# Altium project KJ_Turret_Command.PrjPcb
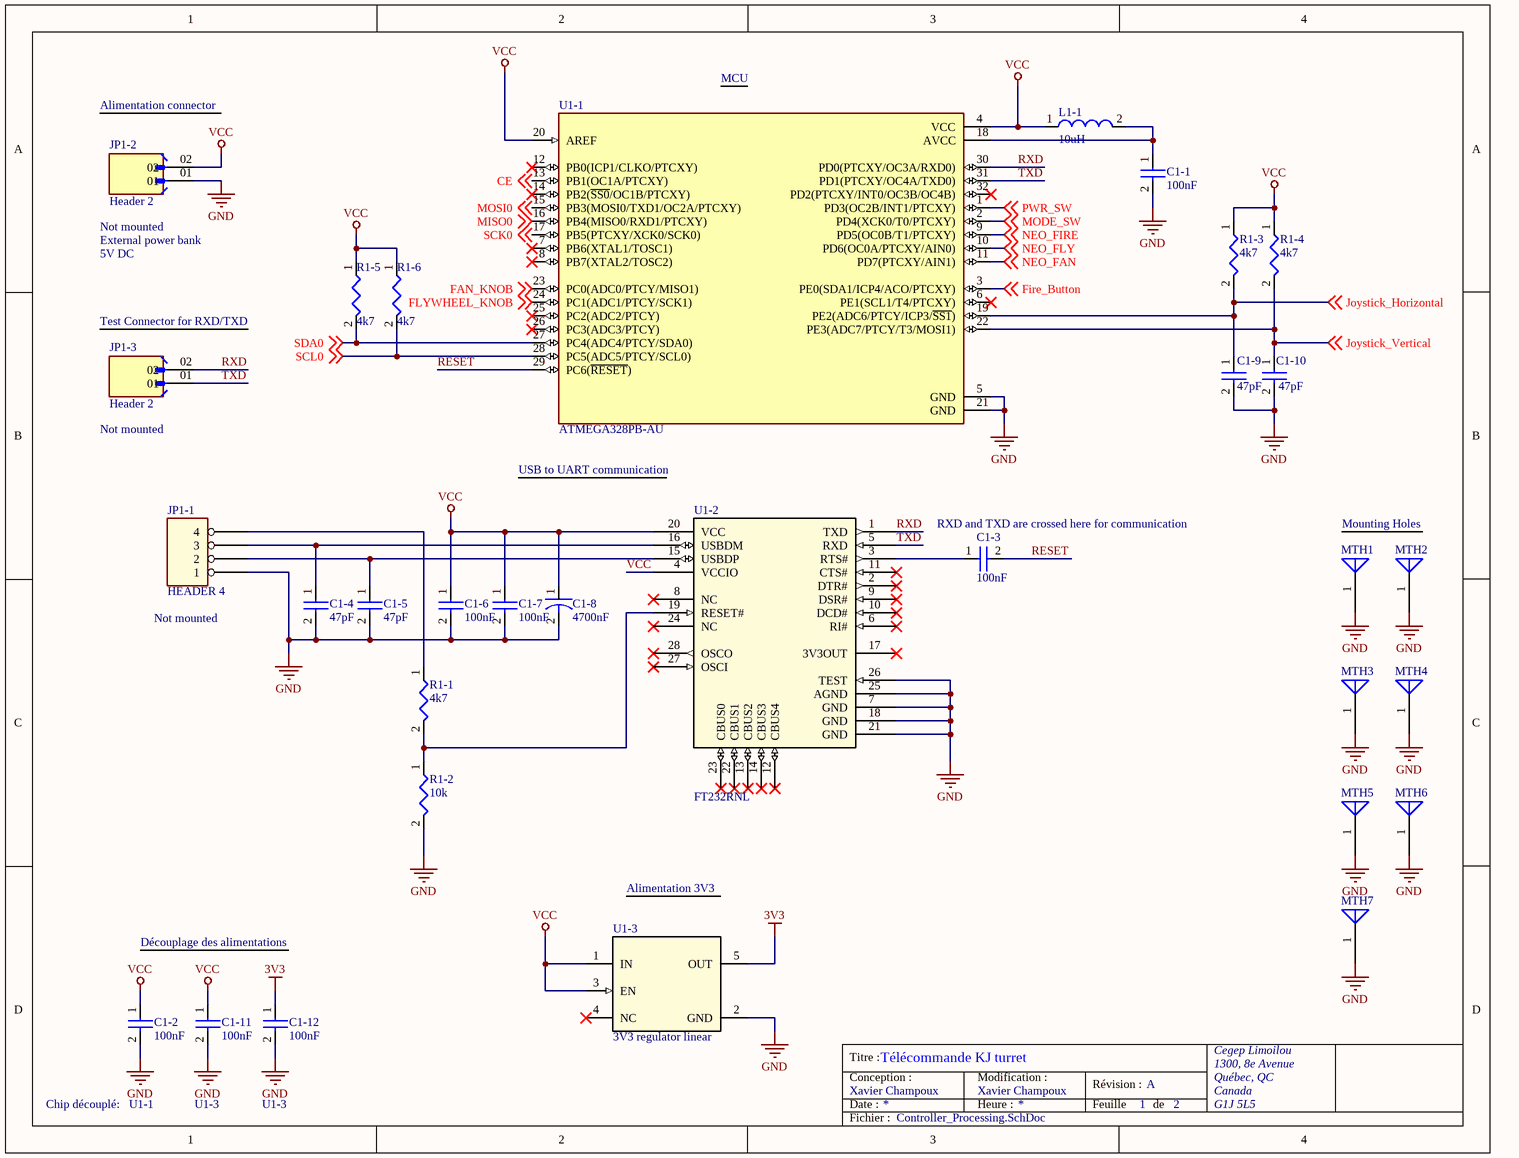
[diagram p0: Controller_Processing.SchDoc]
2 sheets, 66 parts. Net scope: global (net labels, ports and power ports of the same name join across sheets).
Board file: Controller.PcbDoc
Sheets:
  Controller_Processing.SchDoc
  Controller_Accessories.SchDoc

## Sheet Controller_Processing.SchDoc
size Letter; Organization: Cegep Limoilou; Address1: 1300, 8e Avenue; Address2: Québec, QC; Address3: Canada; Address4: G1J 5L5; Revision: A; SheetNumber: 1; SheetTotal: 2; Conception: Xavier Champoux; Titre: Télécommande KJ turret; Modification: Xavier Champoux

### Parts
C1-1  100nF  [0805_SMD]
C1-2  100nF  [0805_SMD]
C1-3  100nF  [0805_SMD]
C1-4  47pF  [0805_SMD]
C1-5  47pF  [0805_SMD]
C1-6  100nF  [0805_SMD]
C1-7  100nF  [0805_SMD]
C1-8  4700nF  [0805_SMD]
C1-9  47pF  [0805_SMD]
C1-10  47pF  [0805_SMD]
C1-11  100nF  [0805_SMD]
C1-12  100nF  [0805_SMD]
JP1-1  HEADER 4  [Header 4]
JP1-2  Header 2  [Header 2]
JP1-3  Header 2  [Header 2]
L1-1  10uH  [0805_SMD]
MTH1  ANTENNA  [MountingHole]  (value not drawn)
MTH2  ANTENNA  [MountingHole]  (value not drawn)
MTH3  ANTENNA  [MountingHole]  (value not drawn)
MTH4  ANTENNA  [MountingHole]  (value not drawn)
MTH5  ANTENNA  [MountingHole]  (value not drawn)
MTH6  ANTENNA  [MountingHole]  (value not drawn)
MTH7  ANTENNA  [MountingHole]  (value not drawn)
R1-1  4k7  [0805_SMD]
R1-2  10k  [0805_SMD]
R1-3  4k7  [0805_SMD]
R1-4  4k7  [0805_SMD]
R1-5  4k7  [0805_SMD]
R1-6  4k7  [0805_SMD]
U1-1  ATMEGA328PB-AU  [QFP80P900X900X120-32N]
U1-2  FT232RNL  [SSOP-28_FTD]
U1-3  3V3 regulator linear  [DBV0005A-IPC_A]

### Nets
3V3: C1-12.1 U1-3.5(OUT)
GND: C1-1.2 C1-2.2 C1-4.2 C1-5.2 C1-6.2 C1-7.2 C1-8.2 C1-9.2 C1-10.2 C1-11.2 C1-12.2 JP1-1.1 JP1-2.01 MTH1.1 MTH2.1 MTH3.1 MTH4.1 MTH5.1 MTH6.1 MTH7.1 R1-2.2 U1-1.5(GND) U1-1.21(GND) U1-2.7(GND) U1-2.18(GND) U1-2.21(GND) U1-2.25(AGND) U1-2.26(TEST) U1-3.2(GND)
VCC: C1-2.1 C1-6.1 C1-7.1 C1-8.1 C1-11.1 JP1-2.02 L1-1.1 R1-3.1 R1-4.1 R1-5.1 R1-6.1 U1-1.4(VCC) U1-1.20(AREF) U1-2.4(VCCIO) U1-2.20(VCC) U1-3.1(IN) U1-3.3(EN)
CE: U1-1.13(PB1(OC1A/PTCXY)) ; off-sheet CE
FAN_KNOB: U1-1.23(PC0(ADC0/PTCY/MISO1)) ; off-sheet FAN_KNOB
Fire_Button: U1-1.3(PE0(SDA1/ICP4/ACO/PTCXY)) ; off-sheet Fire_Button
FLYWHEEL_KNOB: U1-1.24(PC1(ADC1/PTCY/SCK1)) ; off-sheet FLYWHEEL_KNOB
Joystick_Horizontal: C1-9.1 R1-3.2 U1-1.19(PE2(ADC6/PTCY/ICP3/~{SS1})) ; off-sheet Joystick_Horizontal
Joystick_Vertical: C1-10.1 R1-4.2 U1-1.22(PE3(ADC7/PTCY/T3/MOSI1)) ; off-sheet Joystick_Vertical
MISO0: U1-1.16(PB4(MISO0/RXD1/PTCXY)) ; off-sheet MISO0
MODE_SW: U1-1.2(PD4(XCK0/T0/PTCXY)) ; off-sheet MODE_SW
MOSI0: U1-1.15(PB3(MOSI0/TXD1/OC2A/PTCXY)) ; off-sheet MOSI0
NEO_FAN: U1-1.11(PD7(PTCXY/AIN1)) ; off-sheet NEO_FAN
NEO_FIRE: U1-1.9(PD5(OC0B/T1/PTCXY)) ; off-sheet NEO_FIRE
NEO_FLY: U1-1.10(PD6(OC0A/PTCXY/AIN0)) ; off-sheet NEO_FLY
PWR_SW: U1-1.1(PD3(OC2B/INT1/PTCXY)) ; off-sheet PWR_SW
RESET: C1-3.2 U1-1.29(PC6(~{RESET}))
RXD: JP1-3.02 U1-1.30(PD0(PTCXY/OC3A/RXD0)) U1-2.1(TXD)
SCK0: U1-1.17(PB5(PTCXY/XCK0/SCK0)) ; off-sheet SCK0
SCL0: R1-6.2 U1-1.28(PC5(ADC5/PTCY/SCL0)) ; off-sheet SCL0
SDA0: R1-5.2 U1-1.27(PC4(ADC4/PTCY/SDA0)) ; off-sheet SDA0
TXD: JP1-3.01 U1-1.31(PD1(PTCXY/OC4A/TXD0)) U1-2.5(RXD)
NetC1-1_1: C1-1.1 L1-1.2 U1-1.18(AVCC)
NetC1-3_1: C1-3.1 U1-2.3(RTS#)
NetC1-4_1: C1-4.1 JP1-1.3 U1-2.16(USBDM)
NetC1-5_1: C1-5.1 JP1-1.2 U1-2.15(USBDP)
NetJP1-1_4: JP1-1.4 R1-1.1
NetR1-1_2: R1-1.2 R1-2.1 U1-2.19(RESET#)

Not connected (* = marked no-connect by the designer): U1-1 6(PE1(SCL1/T4/PTCXY))* 7(PB6(XTAL1/TOSC1))* 8(PB7(XTAL2/TOSC2))* 12(PB0(ICP1/CLKO/PTCXY))* 14(PB2(~{SS0}/OC1B/PTCXY))* 25(PC2(ADC2/PTCY))* 26(PC3(ADC3/PTCY))* 32(PD2(PTCXY/INT0/OC3B/OC4B))*; U1-2 2(DTR#)* 6(RI#)* 8(NC)* 9(DSR#)* 10(DCD#)* 11(CTS#)* 12(CBUS4)* 13(CBUS2)* 14(CBUS3)* 17(3V3OUT)* 22(CBUS1)* 23(CBUS0)* 24(NC)* 27(OSCI)* 28(OSCO)*; U1-3 4(NC)*

### Notes on the sheet
- (near U1-1) MCU
- Alimentation connector
- (near JP1-2) Not mounted
- External power bank
- 5V DC
- (near JP1-3) Test Connector for RXD/TXD
- (near JP1-3) Not mounted
- USB to UART communication
- (near C1-3) RXD and TXD are crossed here for communication
- Mounting Holes
- (near JP1-1) Not mounted
- Alimentation 3V3
- Découplage des alimentations
- Chip découplé:   U1-1
- U1-3
- Titre :
- Conception :
- Date :
- Modification :
- Heure :
- Révision :
- Feuille
- de
- Fichier :

### Library data of the parts
C1-1-C1-7 C1-9-C1-12 = CAP NP
C1-8 = CAP
JP1-2 JP1-3 = Header 2: MP: GRPB021VWVN-RC; Package: None; Availability: Unavailable; Price: None; Value: *
L1-1 = INDUCTOR
R1-1-R1-6 = R
U1-1 = ATMEGA328PB-AU: MF: Microchip; SnapEDA_Link: https://www.snapeda.com/parts/ATMEGA328PB-AU/Microchip/view-part/?ref=snap; Package: TQFP-32 Microchip; Value: *; MP: ATMEGA328PB-AU; Check_prices: https://www.snapeda.com/parts/ATMEGA328PB-AU/Microchip/view-part/?ref=eda
U1-2 = FT232RNL: Mfr_Name: FTDI, Future Technology Devices International Ltd; RefDes: RefDes; Type: Type
U1-3 = 3V3 regulator linear: No Description Available; Mfr_Name: Texas Instruments; TYPE: TYPE; RefDes: RefDes

## Sheet Controller_Accessories.SchDoc
size Letter; Organization: Cegep Limoilou; Address1: 1300, 8e Avenue; Address2: Québec, QC; Address3: Canada; Address4: G1J 5L5; Revision: A; SheetNumber: 2; SheetTotal: 2; Conception: Xavier Champoux; Titre: Télécommande KJ Turret; Modification: Xavier Champoux
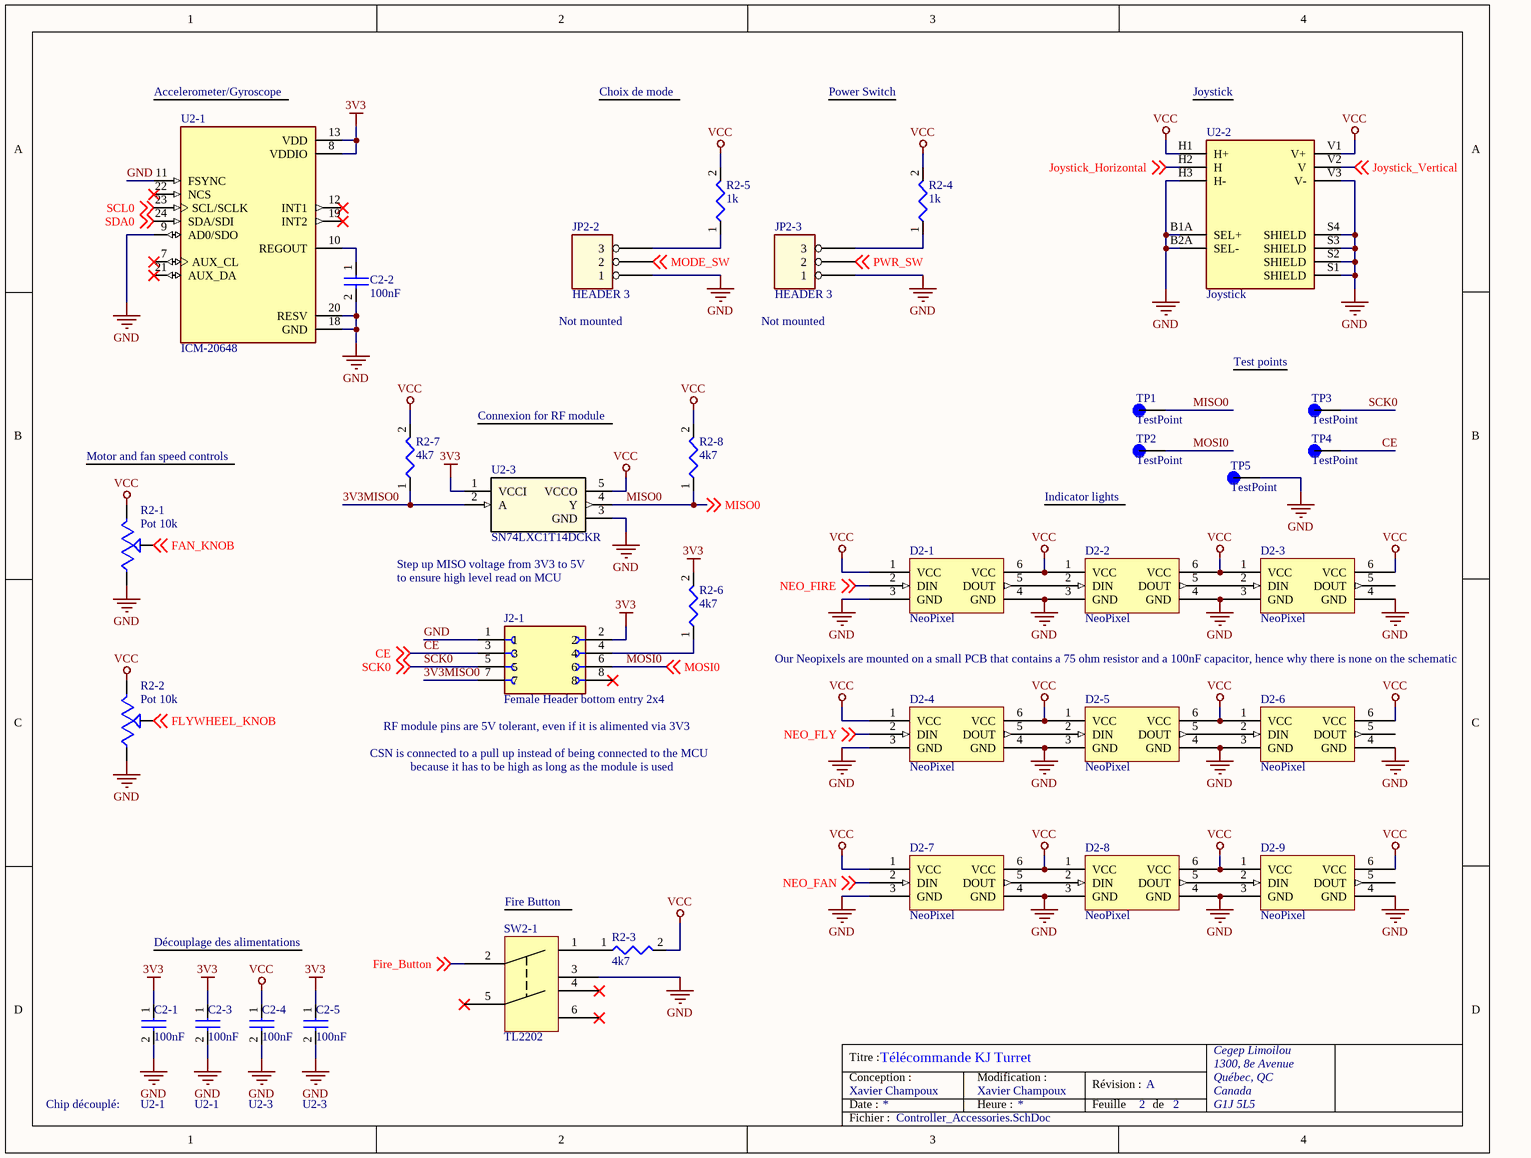
[diagram p1: Controller_Accessories.SchDoc]

### Parts
C2-1  100nF  [0805_SMD]
C2-2  100nF  [0805_SMD]
C2-3  100nF  [0805_SMD]
C2-4  100nF  [0805_SMD]
C2-5  100nF  [0805_SMD]
D2-1  NeoPixel  [NeoPixel]
D2-2  NeoPixel  [NeoPixel]
D2-3  NeoPixel  [NeoPixel]
D2-4  NeoPixel  [NeoPixel]
D2-5  NeoPixel  [NeoPixel]
D2-6  NeoPixel  [NeoPixel]
D2-7  NeoPixel  [NeoPixel]
D2-8  NeoPixel  [NeoPixel]
D2-9  NeoPixel  [NeoPixel]
J2-1  Female Header bottom entry 2x4  [AMPHENOL_71991-306LF]
JP2-2  HEADER 3  [Header 3]
JP2-3  HEADER 3  [Header 3]
R2-1  Pot 10k  [TRIM_PT01-D120K2-B103]
R2-2  Pot 10k  [TRIM_PT01-D120K2-B103]
R2-3  4k7  [0805_SMD]
R2-4  1k  [0805_SMD]
R2-5  1k  [0805_SMD]
R2-6  4k7  [0805_SMD]
R2-7  4k7  [0805_SMD]
R2-8  4k7  [0805_SMD]
SW2-1  TL2202  [TL2202]
TP1  TestPoint  [KEYSTONE_5006]
TP2  TestPoint  [KEYSTONE_5006]
TP3  TestPoint  [KEYSTONE_5006]
TP4  TestPoint  [KEYSTONE_5006]
TP5  TestPoint  [KEYSTONE_5006]
U2-1  ICM-20648  [QFN40P300X300X95-24N]
U2-2  Joystick  [XDCR_COM-09032]
U2-3  SN74LXC1T14DCKR  [DCK0005A-IPC_A]

### Nets
3V3: C2-1.1 C2-3.1 C2-5.1 J2-1.2 R2-6.2 U2-1.8(VDDIO) U2-1.13(VDD) U2-3.1(VCCI)
GND: C2-1.2 C2-2.2 C2-3.2 C2-4.2 C2-5.2 D2-1.3(GND) D2-1.4(GND) D2-2.3(GND) D2-2.4(GND) D2-3.3(GND) D2-3.4(GND) D2-4.3(GND) D2-4.4(GND) D2-5.3(GND) D2-5.4(GND) D2-6.3(GND) D2-6.4(GND) D2-7.3(GND) D2-7.4(GND) D2-8.3(GND) D2-8.4(GND) D2-9.3(GND) D2-9.4(GND) J2-1.1 JP2-2.1 JP2-3.1 R2-1.3 R2-2.3 SW2-1.3 TP5.TP U2-1.9(AD0/SDO) U2-1.11(FSYNC) U2-1.18(GND) U2-1.20(RESV) U2-2.B1A(SEL+) U2-2.B2A(SEL-) U2-2.H3(H-) U2-2.S1(SHIELD) U2-2.S2(SHIELD) U2-2.S3(SHIELD) U2-2.S4(SHIELD) U2-2.V3(V-) U2-3.3(GND)
VCC: C2-4.1 D2-1.1(VCC) D2-1.6(VCC) D2-2.1(VCC) D2-2.6(VCC) D2-3.1(VCC) D2-3.6(VCC) D2-4.1(VCC) D2-4.6(VCC) D2-5.1(VCC) D2-5.6(VCC) D2-6.1(VCC) D2-6.6(VCC) D2-7.1(VCC) D2-7.6(VCC) D2-8.1(VCC) D2-8.6(VCC) D2-9.1(VCC) D2-9.6(VCC) R2-1.1 R2-2.1 R2-3.2 R2-4.2 R2-5.2 R2-7.2 R2-8.2 U2-2.H1(H+) U2-2.V1(V+) U2-3.5(VCCO)
3V3MISO0: J2-1.7 R2-7.1 U2-3.2(A)
CE: J2-1.3 TP4.TP ; off-sheet CE
FAN_KNOB: R2-1.2 ; off-sheet FAN_KNOB
Fire_Button: SW2-1.2 ; off-sheet Fire_Button
FLYWHEEL_KNOB: R2-2.2 ; off-sheet FLYWHEEL_KNOB
Joystick_Horizontal: U2-2.H2(H) ; off-sheet Joystick_Horizontal
Joystick_Vertical: U2-2.V2(V) ; off-sheet Joystick_Vertical
MISO0: R2-8.1 TP1.TP U2-3.4(Y) ; off-sheet MISO0
MODE_SW: JP2-2.2 ; off-sheet MODE_SW
MOSI0: J2-1.6 TP2.TP ; off-sheet MOSI0
NEO_FAN: D2-7.2(DIN) ; off-sheet NEO_FAN
NEO_FIRE: D2-1.2(DIN) ; off-sheet NEO_FIRE
NEO_FLY: D2-4.2(DIN) ; off-sheet NEO_FLY
PWR_SW: JP2-3.2 ; off-sheet PWR_SW
SCK0: J2-1.5 TP3.TP ; off-sheet SCK0
SCL0: U2-1.23(SCL/SCLK) ; off-sheet SCL0
SDA0: U2-1.24(SDA/SDI) ; off-sheet SDA0
NetC2-2_1: C2-2.1 U2-1.10(REGOUT)
NetD2-1_5: D2-1.5(DOUT) D2-2.2(DIN)
NetD2-2_5: D2-2.5(DOUT) D2-3.2(DIN)
NetD2-4_5: D2-4.5(DOUT) D2-5.2(DIN)
NetD2-5_5: D2-5.5(DOUT) D2-6.2(DIN)
NetD2-7_5: D2-7.5(DOUT) D2-8.2(DIN)
NetD2-8_5: D2-8.5(DOUT) D2-9.2(DIN)
NetJ2-1_4: J2-1.4 R2-6.1
NetJP2-2_3: JP2-2.3 R2-5.1
NetJP2-3_3: JP2-3.3 R2-4.1
NetR2-3_1: R2-3.1 SW2-1.1

Not connected (* = marked no-connect by the designer): D2-3 5(DOUT); D2-6 5(DOUT); D2-9 5(DOUT); J2-1 8*; SW2-1 4* 5* 6*; U2-1 7(AUX_CL)* 12(INT1)* 19(INT2)* 21(AUX_DA)* 22(NCS)*

### Notes on the sheet
- (near U2-1) Accelerometer/Gyroscope
- Choix de mode
- Power Switch
- Joystick
- (near JP2-2) Not mounted
- (near JP2-3) Not mounted
- (near TP3) Test points
- Connexion for RF module
- Motor and fan speed controls
- (near TP2) Indicator lights
- (near U2-3) Step up MISO voltage from 3V3 to 5V
- to ensure high level read on MCU
- Our Neopixels are mounted on a small PCB that contains a 75 ohm resistor and a 100nF capacitor, hence why there is none on the schematic
- CSN is connected to a pull up instead of being connected to the MCU
- (near J2-1) RF module pins are 5V tolerant, even if it is alimented via 3V3
- because it has to be high as long as the module is used
- Fire Button
- Découplage des alimentations
- Chip découplé:
- U2-1
- U2-3
- Titre :
- Conception :
- Date :
- Modification :
- Heure :
- Révision :
- Feuille
- de
- Fichier :

### Library data of the parts
C2-1-C2-5 = CAP NP
J2-1 = Female Header bottom entry 2x4: MF: Amphenol; MP: 71991-306LF; Package: None; Price: None; Check_prices: https://www.snapeda.com/parts/71991-306LF/Amphenol/view-part/?ref=eda; Value: *; SnapEDA_Link: https://www.snapeda.com/parts/71991-306LF/Amphenol/view-part/?ref=snap; Availability: In Stock; Purchase-URL: https://pricing.snapeda.com/search?q=71991-306LF&ref=eda
R2-1 R2-2 = Potentiometer knob: MP: PT01-D120K2-B103; Value: *; Availability: Unavailable; Package: None; Price: None
R2-3-R2-8 = R
TP1-TP5 = TestPoint: MF: Keystone Electronics Corp.; MP: 5006; SnapEDA_Link: https://www.snapeda.com/parts/5006/Keystone/view-part/?ref=snap; Package: NON STANDARD-1 Keystone; Value: *; Check_prices: https://www.snapeda.com/parts/5006/Keystone/view-part/?ref=eda
U2-1 = ICM-20648: MF: TDK InvenSense; MP: ICM-20648; Package: QFN-24 InvenSense; Price: None; Value: *; SnapEDA_Link: https://www.snapeda.com/parts/ICM-20648/TDK%20InvenSense/view-part/474513/?ref=snap; Availability: Unavailable
U2-2 = Joystick: MP: COM-09032; Price: None; Availability: Unavailable; Value: *; Package: None
U2-3 = SN74LXC1T14DCKR: Mfr_Name: Texas Instruments; TYPE: TYPE; RefDes: RefDes

## Nets that join several sheets
3V3: Controller_Processing (C1-12.1 U1-3.5), Controller_Accessories (8 pins)
GND: Controller_Processing (29 pins), Controller_Accessories (43 pins)
VCC: Controller_Processing (17 pins), Controller_Accessories (29 pins)
CE: Controller_Processing (U1-1.13), Controller_Accessories (J2-1.3 TP4.TP)
FAN_KNOB: Controller_Processing (U1-1.23), Controller_Accessories (R2-1.2)
Fire_Button: Controller_Processing (U1-1.3), Controller_Accessories (SW2-1.2)
FLYWHEEL_KNOB: Controller_Processing (U1-1.24), Controller_Accessories (R2-2.2)
Joystick_Horizontal: Controller_Processing (C1-9.1 R1-3.2 U1-1.19), Controller_Accessories (U2-2.H2)
Joystick_Vertical: Controller_Processing (C1-10.1 R1-4.2 U1-1.22), Controller_Accessories (U2-2.V2)
MISO0: Controller_Processing (U1-1.16), Controller_Accessories (R2-8.1 TP1.TP U2-3.4)
MODE_SW: Controller_Processing (U1-1.2), Controller_Accessories (JP2-2.2)
MOSI0: Controller_Processing (U1-1.15), Controller_Accessories (J2-1.6 TP2.TP)
NEO_FAN: Controller_Processing (U1-1.11), Controller_Accessories (D2-7.2)
NEO_FIRE: Controller_Processing (U1-1.9), Controller_Accessories (D2-1.2)
NEO_FLY: Controller_Processing (U1-1.10), Controller_Accessories (D2-4.2)
PWR_SW: Controller_Processing (U1-1.1), Controller_Accessories (JP2-3.2)
SCK0: Controller_Processing (U1-1.17), Controller_Accessories (J2-1.5 TP3.TP)
SCL0: Controller_Processing (R1-6.2 U1-1.28), Controller_Accessories (U2-1.23)
SDA0: Controller_Processing (R1-5.2 U1-1.27), Controller_Accessories (U2-1.24)